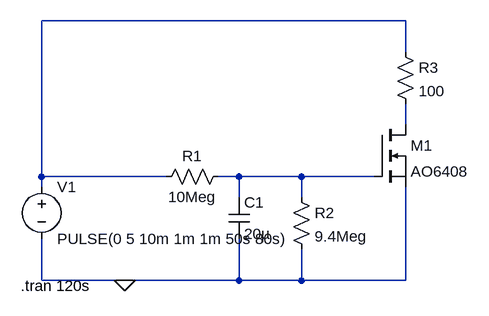
[diagram p0: schematic delayed_led_switch.asc]
delayed_led_switch.asc, the LTspice schematic file:
Version 4
SHEET 1 880 680
WIRE 544 -128 -16 -128
WIRE 544 -80 544 -128
WIRE 544 32 544 0
WIRE -16 112 -16 -128
WIRE 176 112 -16 112
WIRE 288 112 256 112
WIRE 384 112 288 112
WIRE 496 112 384 112
WIRE -16 128 -16 112
WIRE 288 144 288 112
WIRE 384 144 384 112
WIRE -16 272 -16 208
WIRE 112 272 -16 272
WIRE 288 272 288 208
WIRE 288 272 112 272
WIRE 384 272 384 224
WIRE 384 272 288 272
WIRE 544 272 544 128
WIRE 544 272 384 272
FLAG 112 272 0
SYMBOL voltage -16 112 R0
WINDOW 123 0 0 Left 0
WINDOW 39 0 0 Left 0
SYMATTR InstName V1
SYMATTR Value PULSE(0 5 10m 1m 1m 50s 80s)
SYMBOL res 272 96 R90
WINDOW 0 0 56 VBottom 2
WINDOW 3 32 56 VTop 2
SYMATTR InstName R1
SYMATTR Value 10Meg
SYMBOL cap 272 144 R0
SYMATTR InstName C1
SYMATTR Value 20µ
SYMBOL res 368 128 R0
SYMATTR InstName R2
SYMATTR Value 9.4Meg
SYMBOL nmos 496 32 R0
SYMATTR InstName M1
SYMATTR Value AO6408
SYMBOL res 528 -96 R0
SYMATTR InstName R3
SYMATTR Value 100
TEXT -48 280 Left 2 !.tran 120s

The netlist it stands for:
* delayed_led_switch.asc
V1 N001 0 PULSE(0 5 10m 1m 1m 50s 80s)
R1 N003 N001 10Meg
C1 N003 0 20µ
R2 N003 0 9.4Meg
M1 N002 N003 0 0 AO6408
R3 N001 N002 100
.model NMOS NMOS
.model PMOS PMOS
.lib standard.mos
.tran 120s
.backanno
.end